# EasyEDA Pro project travellium-12v-desktop-power-supply-cc8d8467.epro, board EG1163S_C_PCB
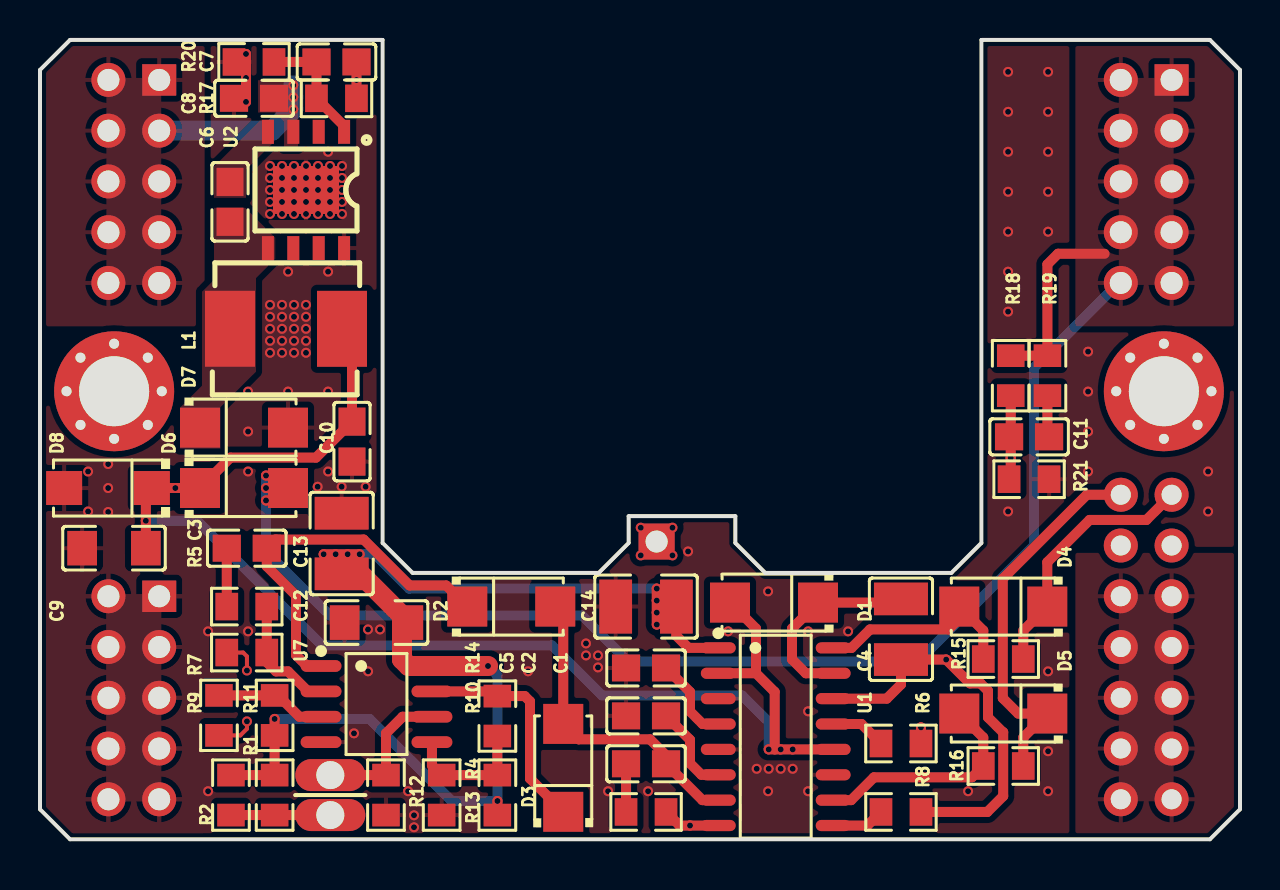
[diagram p13: board, top side]
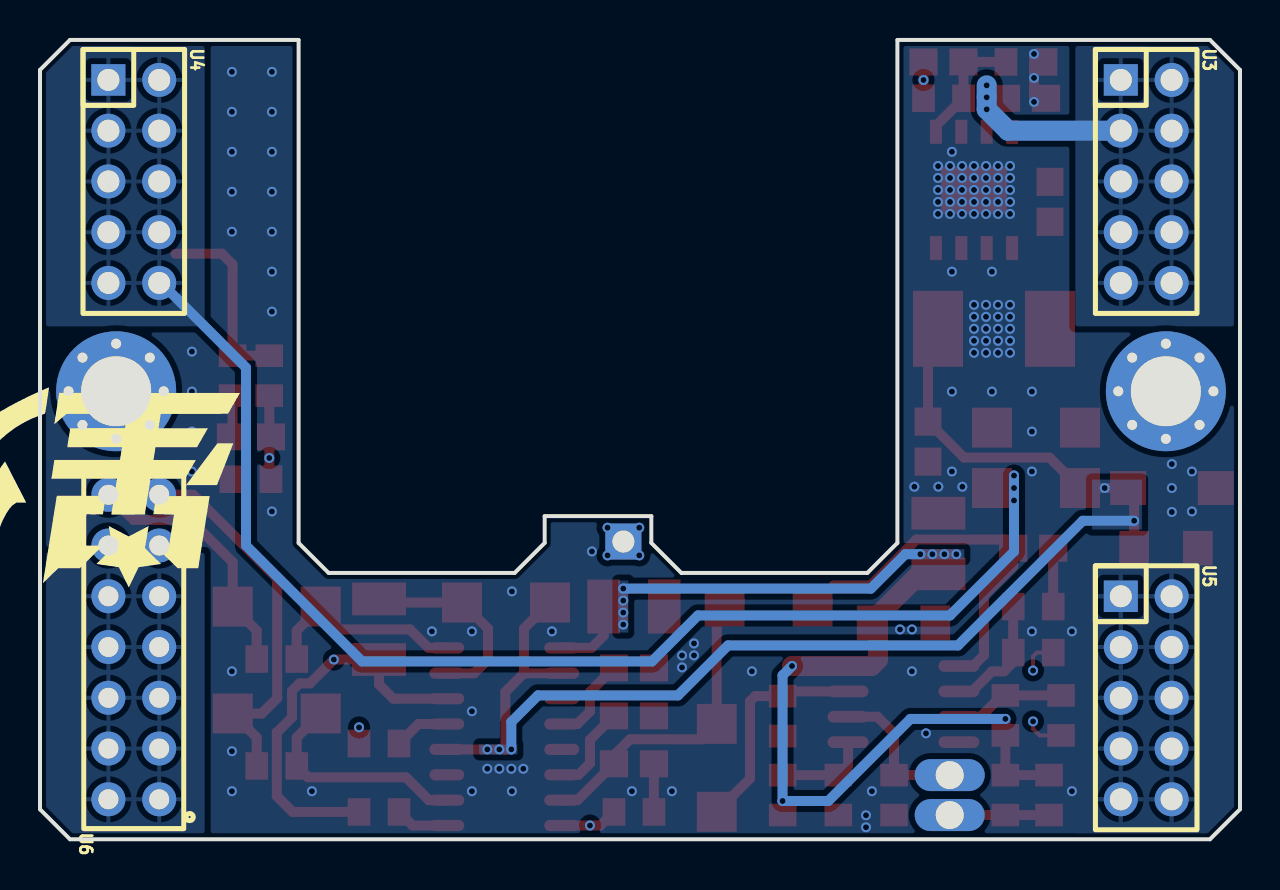
[diagram p14: board, bottom side, seen from below]

Outline 60 x 40 mm; copper layers: Top Layer, Inner1, Inner2, Bottom Layer. Coordinates in mm from the lower left corner of the outline.
Outline path: 0,38.5 0,1.5 1.5,0 58.5,0 60,1.5 60,38.5 58.5,40 47.07,40 47.07,14.83 45.57,13.33 36.27,13.33 34.77,14.83 34.77,16.17 29.43,16.17 29.43,14.83 27.93,13.33 18.63,13.33 17.13,14.83 17.13,40 1.5,40 0,38.5
Stack: Top Layer 0.035mm 外层铜厚1oz / Dielectric1 0.2104mm 7628 RC49% 8.6mil / Inner1 0.0152mm 内层铜厚 / Dielectric2 1.065mm 1.1mm H/HOZ Copper / Inner2 0.0152mm 内层铜厚 / Dielectric3 0.2104mm 7628 RC49% 8.6mil / Bottom Layer 0.035mm 外层铜厚1oz

## Design rules (mm)
net N: DP2
net P: DP2
spacing copperThickness1oz (default): track to track 0.102, other pairs 0.152 to 0.3
spacing copperThickness2oz: track to track 0.203, other pairs 0.152 to 0.3
spacing Plane_innerPlane: track to track 0.102, other pairs 0.152 to 0.3
spacing Copper_copperRegion: track to track 0.102, other pairs 0.152 to 0.3
track width copperThickness1oz: min 0.127, default 0.254, max 2.54
track width copperThickness2oz: min 0.203, default 0.254, max 2.54
track width Travellium (default): min 0.1, default 0.2, max 10
differential pair differentialPair (default): width min 0.127, default 0.254, max 2.54; gap min 0.152, default 0.152
pour e472 uses Copper_copperRegion
pour e514 uses Copper_copperRegion
pour e556 uses Copper_copperRegion
pour e598 uses Copper_copperRegion
pour e640 uses Copper_copperRegion
pour e682 uses Copper_copperRegion
pour e724 uses Copper_copperRegion
pour e766 uses Copper_copperRegion
pour e808 uses Copper_copperRegion
pour e850 uses Copper_copperRegion
pour e892 uses Copper_copperRegion
pour e934 uses Copper_copperRegion
pour e976 uses Copper_copperRegion
pour e1018 uses Copper_copperRegion
pour e1060 uses Copper_copperRegion
pour e1102 uses Copper_copperRegion
pour e1144 uses Copper_copperRegion
pour e1186 uses Copper_copperRegion
pour e1293 uses Copper_copperRegion
pour e1335 uses Copper_copperRegion
pour e1380 uses Copper_copperRegion

## Placement (name value [footprint] x y rotation side)
C1  100pF  [C0805]  30.3 8.57 180 top
C2  47pF  [C0805]  30.3 6.17 0 top
C3  10nF  [C0805]  10.34 14.57 180 top
C4  10uF  [C1210]  43.05 10.51 270 top
C5  10nF  [C0805]  30.3 3.78 180 top
C6  100nF  [C0805]  9.5 31.9 270 top
C7  150pF  [C0805]  14.82 38.9 180 top
C8  22uF  [C0805]  10.7 37.08 180 top
C9  100nF  [C1206]  3.7 14.57 0 top
C10  22uF  [C0805]  15.6 19.9 270 top
C11  10nF  [C0805]  49.45 20.14 0 top
C12  100nF  [C1206]  16.82 10.84 0 top
C13  10uF  [C1210]  15.08 14.8 270 top
C14  10uF  [C1210]  30.3 11.64 0 top
D1  SS34  [SMA_L4.3-W2.6-LS5.2-RD]  36.7 11.84 180 top
D2  SS34  [SMA_L4.3-W2.6-LS5.2-RD]  23.56 11.64 0 top
D3  SS34  [SMA_L4.3-W2.6-LS5.2-RD]  26.16 3.57 90 top
D4  SS34  [SMA_L4.3-W2.6-LS5.2-RD]  48.16 11.64 180 top
D5  SS34  [SMA_L4.3-W2.6-LS5.2-RD]  48.16 6.29 180 top
D6  SS34  [SMA_L4.3-W2.6-LS5.2-RD]  10.2 17.58 0 top
D7  SS310  [SMA_L4.3-W2.6-LS5.2-RD]  10.2 20.6 0 top
D8  1SMA4742A  [SMA_L4.4-W2.6-LS5.0-RD]  3.4 17.58 180 top
L1  68uH  [IND-SMD_L7.1-W6.6-1]  12.3 25.55 0 top
NOREF  -  [Pad_e175]  57.88 20.74 225 top
NOREF#2  -  [Pad_e168]  5.39 20.74 225 top
NOREF#3  -  [Pad_e171]  54.51 24.1 45 top
NOREF#4  -  [Pad_e180]  14.51 3.21 0 top
NOREF#5  -  [Pad_e174]  56.19 20.04 180 top
NOREF#6  -  [Pad_e170]  5.39 24.1 315 top
NOREF#7  -  [Pad_e172]  53.81 22.42 90 top
NOREF#8  -  [Pad_e161]  56.19 22.42 0 top
NOREF#9  -  [Pad_e165]  1.33 22.42 90 top
NOREF#10  -  [Pad_e176]  58.57 22.42 270 top
NOREF#11  -  [Pad_e162]  3.71 22.42 0 top
NOREF#12  -  [Pad_e177]  57.88 24.1 315 top
NOREF#13  -  [Pad_e163]  3.71 24.8 0 top
NOREF#14  -  [Pad_e167]  3.71 20.04 180 top
NOREF#15  -  [Pad_e173]  54.51 20.74 135 top
NOREF#16  -  [Pad_e166]  2.02 20.74 135 top
NOREF#17  -  [Pad_e181]  14.51 1.21 0 top
NOREF#18  -  [Pad_e179]  30.83 14.9 0 top
NOREF#19  -  [Pad_e178]  56.19 24.8 0 top
NOREF#20  -  [Pad_e164]  2.02 24.1 45 top
NOREF#21  -  [Pad_e169]  6.09 22.42 270 top
R1  120kΩ  [R0805]  11.73 2.21 90 top
R2  10kΩ  [R0805]  9.55 2.21 270 top
R4  10kΩ  [R0805]  22.87 2.21 270 top
R5  20kΩ  [R0805]  10.34 11.64 180 top
R6  100kΩ  [R0805]  43.05 4.79 0 top
R7  2kΩ  [R0805]  10.34 9.34 0 top
R8  100kΩ  [R0805]  43.05 1.37 0 top
R9  2kΩ  [R0805]  8.95 6.2 90 top
R10  470kΩ  [R0805]  22.87 6.17 90 top
R11  220kΩ  [R0805]  11.73 6.2 90 top
R12  10kΩ  [R0805]  17.3 2.21 90 top
R13  10kΩ  [R0805]  20.08 2.21 90 top
R14  20kΩ  [R0805]  30.3 1.37 180 top
R15  6.8Ω  [R0805]  48.16 9.02 0 top
R16  6.8Ω  [R0805]  48.16 3.67 0 top
R17  270kΩ  [R0805]  14.82 37.08 0 top
R18  18kΩ  [R0805]  48.54 23.2 90 top
R19  2kΩ  [R0805]  50.37 23.2 90 top
R20  30kΩ  [R0805]  10.7 38.9 0 top
R21  2kΩ  [R0805]  49.45 18.02 180 top
U1  EG1163S  [SOP-16_L10.0-W3.9-P1.27-LS6.0-BL]  36.79 5.13 270 top
U2  SCT2A25STER  [ESOP-8_L4.9-W3.9-P1.27-LS6.0-BL-EP]  13.3 32.49 180 top
U3  PM254-2-05-Z-8.5  [HDR-TH_10P-P2.54-V-F-R2-C5-S2.54]  4.69 32.92 270 bottom
U4  PM254-2-05-Z-8.5  [HDR-TH_10P-P2.54-V-F-R2-C5-S2.54]  55.31 32.92 270 bottom
U5  PM254-2-05-Z-8.5  [HDR-TH_10P-P2.54-V-F-R2-C5-S2.54]  4.69 7.08 270 bottom
U6  PM254-2-07-Z-8.5  [HDR-TH_14P-P2.54-V-F-R2-C7-S2.54]  55.31 9.62 90 bottom
U7  GS8552-SR  [SOIC-8_L4.9-W3.9-P1.27-LS6.0-BL]  16.82 6.77 270 top

## Footprints (pads in the part's own frame, mm; a bottom-side part is the same pattern mirrored in y, then rotated)
C0805
  rect 1.41x1.35 smd: 1(-1,0) 2(1,0)
C1206
  rect 1.485x1.728 smd: 1(-1.593,0) 2(1.593,0)
C1210
  rect 1.635x2.7 smd: 1(-1.518,0) 2(1.518,0)
ESOP-8_L4.9-W3.9-P1.27-LS6.0-BL-EP
  rect 0.6x1.2 smd: 1(-1.905,-2.909) 2(-0.635,-2.909) 3(0.635,-2.909) 4(1.905,-2.909) 5(1.905,2.909) 6(0.635,2.909) 7(-0.635,2.909) 8(-1.905,2.909)
  rect 3.3x2.4 smd: 9(0,0)
HDR-TH_10P-P2.54-V-F-R2-C5-S2.54
  rect 1.575x1.7 hole 1.1: 1(-5.08,-1.27)
  round 1.7 hole 1.1: 2(-5.08,1.27) 3(-2.54,-1.27) 4(-2.54,1.27) 5(0,-1.27) 6(0,1.27) 7(2.54,-1.27) 8(2.54,1.27) 9(5.08,-1.27) 10(5.08,1.27)
HDR-TH_14P-P2.54-V-F-R2-C7-S2.54
  round 1.7 hole 1: 1(-7.62,-1.27) 2(-7.62,1.27) 3(-5.08,-1.27) 4(-5.08,1.27) 5(-2.54,-1.27) 6(-2.54,1.27) 7(0,-1.27) 8(0,1.27) 9(2.54,-1.27) 10(2.54,1.27) 11(5.08,-1.27) 12(5.08,1.27) 13(7.62,-1.27) 14(7.62,1.27)
IND-SMD_L7.1-W6.6-1
  rect 2.5x3.8 smd: 1(-2.8,0) 2(2.8,0)
Pad_e161
  round 6 hole 3.5: 1(0,0)
Pad_e162
  round 6 hole 3.5: 1(0,0)
Pad_e163
  round 1 hole 0.5: 1(0,0)
Pad_e164
  round 1 hole 0.5: 1(0,0)
Pad_e165
  round 1 hole 0.5: 1(0,0)
Pad_e166
  round 1 hole 0.5: 1(0,0)
Pad_e167
  round 1 hole 0.5: 1(0,0)
Pad_e168
  round 1 hole 0.5: 1(0,0)
Pad_e169
  round 1 hole 0.5: 1(0,0)
Pad_e170
  round 1 hole 0.5: 1(0,0)
Pad_e171
  round 1 hole 0.5: 1(0,0)
Pad_e172
  round 1 hole 0.5: 1(0,0)
Pad_e173
  round 1 hole 0.5: 1(0,0)
Pad_e174
  round 1 hole 0.5: 1(0,0)
Pad_e175
  round 1 hole 0.5: 1(0,0)
Pad_e176
  round 1 hole 0.5: 1(0,0)
Pad_e177
  round 1 hole 0.5: 1(0,0)
Pad_e178
  round 1 hole 0.5: 1(0,0)
Pad_e179
  rect 1.8x1.8 hole 1.1: 1(0,0)
Pad_e180
  oval 3.5x1.6 hole 1.4: 1(0,0)
Pad_e181
  oval 3.5x1.6 hole 1.4: 2(0,0)
R0805
  rect 1.133x1.377 smd: 1(-1,0) 2(1,0)
SMA_L4.3-W2.6-LS5.2-RD
  rect 2x2 smd: 1(-2.2,0) 2(2.2,0)
SMA_L4.4-W2.6-LS5.0-RD
  rect 1.8x1.7 smd: 1(-2.192,0) 2(2.192,0)
SOIC-8_L4.9-W3.9-P1.27-LS6.0-BL
  oval 0.588x2.045 smd: 1(-1.905,-2.772) 2(-0.635,-2.772) 3(0.635,-2.772) 4(1.905,-2.772) 5(1.905,2.772) 6(0.635,2.772) 7(-0.635,2.772) 8(-1.905,2.772)
SOP-16_L10.0-W3.9-P1.27-LS6.0-BL
  oval 0.56x1.745 smd: 1(-4.445,-2.873) 2(-3.175,-2.873) 3(-1.905,-2.873) 4(-0.635,-2.873) 5(0.635,-2.873) 6(1.905,-2.873) 7(3.175,-2.873) 8(4.445,-2.873) 9(4.445,2.873) 10(3.175,2.873) 11(1.905,2.873) 12(0.635,2.873) 13(-0.635,2.873) 14(-1.905,2.873) 15(-3.175,2.873) 16(-4.445,2.873)

## Nets
GND: C1.2 C2.1 C8.2 C9.1 C10.2 C12.1 C13.1 C14.1 D7.2 D8.2 R12.1 R13.1 R20.1 R21.1 U1.3 U1.5 U1.11 U2.8 U2.9 U5.1 U5.2 U5.3 U5.4 U5.5 U5.6 U5.7 U5.8 U5.9 U5.10 U7.4
P5V: C12.2 C13.2 C14.2 R1.2 R2.1 R4.2 R11.1 U1.1 U7.8
P12V: D6.2 R18.2 R19.2 U4.1 U4.2 U4.3 U4.4 U4.5 U4.6 U4.7 U4.8 U4.9 U4.10
P60V: C8.1 R6.2 U2.3 U3.1 U3.2 U3.3 U3.4 U3.5 U3.6 U3.7 U3.8 U3.9 U3.10
VCC: C7.1 C9.2 C10.1 D1.2 D6.1 D8.1 L1.2 R17.2 U1.2 U1.12
CP: C2.2 U1.6
ERRO: C5.1 D2.2 D3.2 U1.7
FB: C11.1 R14.1 R18.1 R21.2 U1.8
HG: D4.1 R15.2 U6.14
HO: D4.2 R15.1 U1.16
IN: U6.1 U6.2 U6.3 U6.4 U6.5 U6.6 U6.7 U6.8 U6.9 U6.10
LG: D5.1 R16.2 U6.13
LO: D5.2 R16.1 U1.10
N: R9.1 U6.11
OUT1: C3.1 D2.1 U7.1
OUT2: D3.1 R10.2 U7.7
P: R7.1 U6.12
SDHIN: R6.1 U1.13
SDLIN: R8.1 U1.9
SS: C1.1 U1.4
VB: C4.1 D1.1 U1.15
VS: C4.2 NOREF#18.1 R8.2 U1.14
$1N6441: C5.2 R14.2
$1N6469: R5.1 R7.2 U7.2
$1N6471: NOREF#4.1 R12.2 U7.6
$1N6473: R9.2 R11.2 U7.3
$1N6474: R4.1 R10.1 R13.2 U7.5
$1N6479: C3.2 R5.2
$1N6497: NOREF#17.2 R1.1 R2.2
$1N26204: C6.2 D7.1 L1.1 U2.5
$1N26207: C7.2 R17.1 R20.2 U2.1
$1N26211: C6.1 U2.4
$1N28735: C11.2 R19.1

Pads without a net: NOREF 1; NOREF#2 1; NOREF#3 1; NOREF#5 1; NOREF#6 1; NOREF#7 1; NOREF#8 1; NOREF#9 1; NOREF#10 1; NOREF#11 1; NOREF#12 1; NOREF#13 1; NOREF#14 1; NOREF#15 1; NOREF#16 1; NOREF#19 1; NOREF#20 1; NOREF#21 1; U2 2 6 7

## Via types
v1: diameter 0.5, hole 0.3, Top Layer to Bottom Layer, 160 vias

## Routing (per net, layer and track width the routed paths; a pad name or vN(x,y) marks a point on that pad's centre or on a via; arc(x,y) is an arc through that point)
GND: length 2.4
  Top Layer w0.5: v1(10.3,39.3) v1(10.3,38.1) v1(10.3,36.9)
  vias: v1(2.4,18.4) v1(2.4,16.4) v1(3.41,18.78) v1(3.41,17.58) v1(3.41,16.38) v1(8.4,10.4) v1(8.4,2.4) v1(10.4,22.4) v1(10.4,20.4) v1(10.4,18.4) v1(10.4,10.4) v1(11.5,33.69) v1(11.5,33.09) v1(11.5,32.49) v1(11.5,31.89) v1(11.5,31.29) v1(11.5,26.75) v1(11.5,26.14) v1(11.5,25.55) v1(11.5,24.94) v1(11.5,24.34) v1(12.1,33.69) v1(12.1,33.09) v1(12.1,32.49) v1(12.1,31.89) v1(12.1,31.29) v1(12.1,26.75) v1(12.1,26.14) v1(12.1,25.55) v1(12.1,24.94) v1(12.1,24.34) v1(12.4,28.4) v1(12.4,22.4) v1(12.7,33.69) v1(12.7,33.09) v1(12.7,32.49) v1(12.7,31.89) v1(12.7,31.29) v1(12.7,26.75) v1(12.7,26.14) v1(12.7,25.55) v1(12.7,24.94) v1(12.7,24.34) v1(13.3,33.69) v1(13.3,33.09) v1(13.3,32.49) v1(13.3,31.89) v1(13.3,31.29) v1(13.3,26.75) v1(13.3,26.14) v1(13.3,25.55) v1(13.3,24.94) v1(13.3,24.34) v1(13.9,33.69) v1(13.9,33.09) v1(13.9,32.49) v1(13.9,31.89) v1(13.9,31.29) v1(13.88,17.64) v1(14.4,34.4) v1(14.4,28.4) v1(14.4,22.4) v1(14.4,18.4) v1(14.5,33.69) v1(14.5,33.09) v1(14.5,32.49) v1(14.5,31.89) v1(14.5,31.29) v1(15.1,33.69) v1(15.1,33.09) v1(15.1,32.49) v1(15.1,31.89) v1(15.1,31.29) v1(15.08,17.64) v1(15.7,5.3) v1(16.28,17.64) v1(16.4,10.5) v1(16.4,8.4) v1(17,10.5) v1(18.4,2.4) v1(18.7,1.2) v1(18.7,0.6) v1(24.4,8.4) v1(27.3,9.8) v1(27.3,9.2) v1(27.9,9.2) v1(27.9,8.6) v1(28.4,2.4) v1(30.4,2.4) v1(32.4,14.4) v1(34.4,10.4) v1(35.83,3.53) v1(36.4,12.4) v1(36.43,3.53) v1(36.4,2.4) v1(37.03,3.53) v1(37.63,3.53) v1(38.4,10.4) v1(38.4,6.4) v1(38.4,2.4) v1(40.4,10.4) v1(46.4,2.4) v1(48.4,38.4) v1(48.4,36.4) v1(48.4,34.4) v1(48.4,32.4) v1(48.4,30.4) v1(48.4,28.4) v1(48.4,26.4) v1(48.4,16.4) v1(50.4,38.4) v1(50.4,36.4) v1(50.4,34.4) v1(50.4,32.4) v1(50.4,30.4) v1(50.4,8.4) v1(50.4,4.4) v1(50.4,2.4) v1(52.4,24.4) v1(52.4,22.4) v1(52.4,20.4) v1(52.4,18.4) v1(58.4,18.4) v1(58.4,16.4)
P5V: length 59.4
  Top Layer w0.5: R4.2 22.87,1.22 v1(22.87,1.92) ; C14.2 31.82,10.18 32.42,9.58 U1.1 ; v1(30.84,10.74) v1(30.84,11.34) v1(30.84,11.94) v1(30.84,12.54) ; v1(11.73,6.02) R11.1 R1.2 R2.1 ; v1(14.18,14.26) v1(14.78,14.26) v1(15.38,14.26) v1(15.98,14.26)
  Top Layer w1: v1(22.4,8.67) U7.8 18.43,8.67 18.1,9 18.1,10.53 ; 18.1,10.53 18.1,11.2 16.02,13.28 C13.2 ; 18.1,10.53 C12.2
  Bottom Layer w0.5: v1(11.73,6.02) 16.48,6.02 20.58,1.92 v1(22.87,1.92) 22.87,8.2 v1(22.4,8.67) ; v1(15.98,14.26) 16.74,14.26 18.46,12.54 v1(30.84,12.54)
P12V: length 75.2
  Top Layer w0.5: v1(11.3,16.95) 11.78,16.95 D6.2 ; v1(11.3,17.58) D6.2 ; D6.2 11.78,18.2 v1(11.3,18.2) ; R18.2 R19.2 50.37,28.77 50.9,29.3 53.23,29.3
  Bottom Layer w0.5: U4.10 53.94,27.84 49.7,23.6 49.7,14.7 43.9,8.9 29.4,8.9 27.1,11.2 14.5,11.2 11.3,14.4 v1(11.3,16.95) v1(11.3,17.58) v1(11.3,18.2)
P60V: length 71.8
  Top Layer w0.5: v1(44.05,5.6) R6.2
  Inner2 w0.5: U3.9 5.96,26.04 8.5,23.5 8.5,21.4 5.96,18.86 5.96,15.74 9.7,12 9.7,9.9 8.5,8.7 8.5,6 10,4.5 32.1,4.5 33.2,5.6 v1(44.05,5.6)
  Bottom Layer w1: v1(12.66,37.73) v1(12.66,37.13) v1(12.66,36.53) 11.6,35.46 U3.3
VCC: length 99.6
  Top Layer w0.5: D1.2 35.8,10.54 35.8,8.31 ; 36.73,4.5 36.73,7.37 35.8,8.31 ; 36.73,4.5 v1(37.03,4.5) v1(37.63,4.5) U1.12 ; 36.73,4.5 v1(36.43,4.5) ; R17.2 v1(15.82,38) C7.1 ; C9.2 v1(5.29,15.94) 5.29,17.28 D8.1 v1(6.77,17.58) D6.1 9.52,19.1 13.8,19.1 C10.1 15.6,25.05 L1.2 ; 35.8,8.31 U1.2
  Inner2 w0.5: v1(15.82,38) 16.58,37.24 16.58,21.28 14.8,19.5 8.69,19.5 v1(6.77,17.58)
  Bottom Layer w0.5: v1(36.43,4.5) 36.43,5.87 35.1,7.2 28.1,7.2 25.6,9.7 14.1,9.7 7.86,15.94 v1(5.29,15.94)
CP: length 4.5
  Top Layer w0.5: C2.2 32.5,4.98 32.5,3.8 33.07,3.23 U1.6
ERRO: length 15.6
  Top Layer w0.5: U1.7 33.12,1.96 C5.1 31.3,4.2 30.5,5 26.94,5 D3.2 26.16,11.25 D2.2
FB: length 38.9
  Top Layer w0.5: U1.8 v1(32.5,0.69) 31.98,0.69 R14.1 ; R18.1 v1(48.54,19.08) 48.54,18.1 R21.2
  Inner1 w0.5: v1(48.54,19.08) 49.4,18.22 49.4,7.3 42.79,0.69 v1(32.5,0.69)
HG: length 13
  Top Layer w0.5: R15.2 49.16,10.44 D4.1 50.36,13.86 52.48,15.98 55.32,15.98 U6.14
HO: length 10.9
  Top Layer w0.5: R15.1 47.16,10.44 46.26,11.34 ; 46.56,11.64 46.26,11.34 ; 46.26,11.34 D4.2 ; 46.26,11.34 45.42,10.5 41.5,10.5 40.58,9.58 U1.16
LG: length 19.3
  Top Layer w0.5: R16.2 49.16,5.09 D5.1 48.91,6.29 48.14,7.06 48.14,13.04 52.34,17.24 U6.13
LO: length 11.3
  Top Layer w0.5: D5.2 47.16,5.09 R16.1 46.6,3.1 41.7,3.1 40.56,1.96 U1.10
N: length 53.2
  Top Layer w0.2: R9.1 10.02,5.2 10.35,5.53 v1(10.35,5.9)
  Inner2 w0.2: U6.11 46.34,7 24.44,7 24.3,6.85 24.3,6.48 24.16,6.34 22.92,6.34 22.78,6.48 22.78,6.85 22.63,7 21.39,7 21.25,6.85 21.25,6.48 21.11,6.34 19.87,6.34 19.73,6.48 19.73,6.85 19.59,7 18.34,7 18.2,6.85 18.2,6.48 18.06,6.34 16.82,6.34 16.68,6.48 16.68,6.85 16.54,7 15.3,7 15.16,6.85 15.16,6.48 15.01,6.34 13.77,6.34 13.63,6.48 13.63,6.85 13.49,7 11.44,7 v1(10.35,5.9)
OUT1: length 19
  Top Layer w0.5: D2.1 20.31,12.7 18.48,12.7 16.18,15 11.77,15 C3.1 11.34,13.66 12.8,12.2 12.8,9.22 13.35,8.67 U7.1
OUT2: length 11.3
  Top Layer w0.5: U7.7 22.63,7.4 R10.2 24.23,7.17 24.5,6.9 24.5,3.04 D3.1
P: length 53.2
  Top Layer w0.2: v1(10.35,8.44) 10.35,9.15 10.16,9.34 R7.1
  Inner2 w0.2: U6.12 55.48,15.8 53.4,15.8 52.8,15.2 52.8,13.96 46.19,7.35 11.44,7.35 v1(10.35,8.44)
SDHIN: length 2.8
  Top Layer w0.5: U1.13 41.07,5.77 R6.1
SDLIN: length 2.7
  Top Layer w0.5: U1.9 41.37,0.69 R8.1
SS: length 4.3
  Top Layer w0.5: C1.1 32.5,7.37 32.5,6.4 33.13,5.77 U1.4
VB: length 10
  Top Layer w0.5: 43.05,12.03 42.87,11.84 D1.1 37.6,10.54 37.6,9 38.29,8.31 U1.15
VS: length 38.7
  Top Layer w0.5: U1.14 42.34,7.04 43.05,7.75 C4.2 v1(45.31,8.99) 46.5,7.8 47.03,7.8 47.4,7.42 47.4,6.1 48.15,5.35 48.16,5.35 48.16,2.16 47.37,1.37 R8.2
  Inner2 w0.5: NOREF#18.1 30.93,14.9 v1(31.62,14.2) 32.7,13.13 32.7,10 33.71,8.99 v1(45.31,8.99)
  vias: v1(30.04,15.59) v1(30.04,14.2) v1(31.62,15.59)
$1N6441: length 2.4
  Top Layer w0.5: R14.2 C5.2
$1N6469: length 6.1
  Top Layer w0.5: R5.1 11.34,8.86 11.8,8.4 12.4,8.4 13.4,7.4 U7.2
$1N6471: length 7.5
  Top Layer w0.5: U7.6 18.13,6.13 17.3,5.3 R12.2 NOREF#4.1
$1N6473: length 5.5
  Top Layer w0.5: U7.3 12.97,6.13 11.9,7.2 R9.2
$1N6474: length 6.6
  Top Layer w0.5: U7.5 19.6,3.7 R13.2 R4.1 R10.1
$1N6479: length 2.9
  Top Layer w0.5: R5.2 C3.2
$1N6497: length 5
  Top Layer w0.5: R2.2 R1.1 NOREF#17.2
$1N26207: length 6.2
  Top Layer w0.5: R20.2 C7.2 R17.1 15.21,35.7 U2.1
$1N28735: length 2.1
  Top Layer w0.5: C11.2 50.37,20.22 R19.1

## Copper pours and planes (outline as drawn; the poured copper is in the pictures)
GND on Top Layer: 3.42,12.16 5.99,12.16 5.99,2 3.42,2
GND on Top Layer: 8.23,-0.57 -0.35,-0.57 -0.35,14.33 8.23,14.33
GND on Top Layer: 0,40 60,40 60,0 0,0
GND on Bottom Layer: -0.6,40.6 60.6,40.6 60.6,-0.6 -0.6,-0.6
GND on Bottom Layer: 8.23,-0.57 -0.35,-0.57 -0.35,14.33 8.23,14.33
GND on Inner1: 8.23,-0.57 -0.35,-0.57 -0.35,14.33 8.23,14.33
GND on Inner1: -0.2,40.2 60.2,40.2 60.2,-0.2 -0.2,-0.2
GND on Inner2: 8.23,-0.57 -0.35,-0.57 -0.35,14.33 8.23,14.33
GND on Inner2: -0.4,40.4 60.4,40.4 60.4,-0.4 -0.4,-0.4
P5V on Bottom Layer: 13.78,14.51 16.38,14.51 16.38,14.01 13.78,14.01
P5V on Bottom Layer: 30.59,12.94 31.09,12.94 31.09,10.34 30.59,10.34
P12V on Top Layer: 54.04,38 56.58,38 56.58,27.84 54.04,27.84
P12V on Top Layer: 51.77,40.57 60.35,40.57 60.35,25.67 51.77,25.67
P12V on Bottom Layer: 51.77,40.57 60.35,40.57 60.35,25.67 51.77,25.67
P12V on Inner1: 51.77,40.57 60.35,40.57 60.35,25.67 51.77,25.67
P12V on Inner2: 51.77,40.57 60.35,40.57 60.35,25.67 51.77,25.67
P60V on Top Layer: -0.35,40.57 8.23,40.57 8.23,25.67 -0.35,25.67
P60V on Top Layer: 3.42,38 5.96,38 5.96,27.84 3.42,27.84
P60V on Top Layer: 10.9,37.98 12.9,37.98 12.9,34.6 10.9,34.6
P60V on Bottom Layer: -0.35,40.57 8.23,40.57 8.23,25.67 -0.35,25.67
P60V on Inner1: -0.35,40.57 8.23,40.57 8.23,25.67 -0.35,25.67
P60V on Inner2: -0.35,40.57 8.23,40.57 8.23,25.67 -0.35,25.67
VCC on Bottom Layer: 4.9,18 7.4,18 7.4,15.5 4.9,15.5
IN on Top Layer: 54.04,12.16 56.58,12.16 56.58,2 54.04,2
IN on Top Layer: 60.35,-0.57 51.77,-0.57 51.77,14.33 60.35,14.33
IN on Bottom Layer: 60.35,-0.57 51.77,-0.57 51.77,14.33 60.35,14.33
IN on Inner1: 60.35,-0.57 51.77,-0.57 51.77,14.33 60.35,14.33
IN on Inner1: 60.35,-0.57 51.77,-0.57 51.77,14.33 60.35,14.33
IN on Inner2: 60.35,-0.57 51.77,-0.57 51.77,14.33 60.35,14.33
$1N26204 on Top Layer: 7,31.6 11.76,31.6 11.76,19.55 7,19.55
$1N26211 on Top Layer: 8.7,36.01 11.7,36.01 11.7,32.1 8.7,32.1

Small or netless copper shapes (teardrops, artwork), in the pictures only: 1 on Bottom Layer
